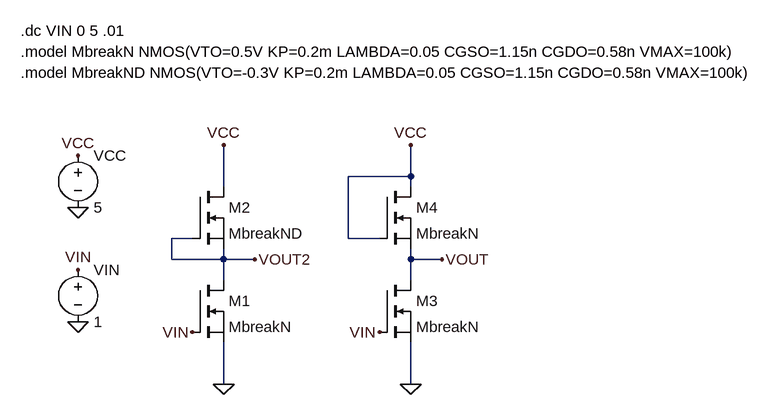
[diagram p0: schematic I_2.asc]
I_2.asc, the LTspice schematic file:
Version 4.1
SHEET 1 1412 680
WIRE 608 96 608 48
WIRE 608 96 512 96
WIRE 320 112 320 48
WIRE 608 112 608 96
WIRE 272 192 240 192
WIRE 512 192 512 96
WIRE 560 192 512 192
WIRE 240 224 240 192
WIRE 320 224 320 208
WIRE 320 224 240 224
WIRE 368 224 320 224
WIRE 608 224 608 208
WIRE 656 224 608 224
WIRE 320 256 320 224
WIRE 608 256 608 224
WIRE 320 416 320 352
WIRE 608 416 608 352
FLAG 320 416 0
FLAG 96 144 0
FLAG 96 64 VCC
FLAG 320 48 VCC
FLAG 96 320 0
FLAG 96 240 VIN
FLAG 272 336 VIN
FLAG 368 224 VOUT2
FLAG 608 416 0
FLAG 608 48 VCC
FLAG 560 336 VIN
FLAG 656 224 VOUT
SYMBOL nmos 272 256 R0
SYMATTR InstName M1
SYMATTR Value MbreakN
SYMBOL voltage 96 48 R0
WINDOW 123 0 0 Left 0
WINDOW 39 0 0 Left 0
SYMATTR InstName VCC
SYMATTR Value 5
SYMBOL nmos 272 112 R0
SYMATTR InstName M2
SYMATTR Value MbreakND
SYMBOL voltage 96 224 R0
WINDOW 123 0 0 Left 0
WINDOW 39 0 0 Left 0
SYMATTR InstName VIN
SYMATTR Value 1
SYMBOL nmos 560 256 R0
SYMATTR InstName M3
SYMATTR Value MbreakN
SYMBOL nmos 560 112 R0
SYMATTR InstName M4
SYMATTR Value MbreakN
TEXT 8 -96 Left 2 !.model MbreakN NMOS(VTO=0.5V KP=0.2m LAMBDA=0.05 CGSO=1.15n CGDO=0.58n VMAX=100k)
TEXT 8 -64 Left 2 !.model MbreakND NMOS(VTO=-0.3V KP=0.2m LAMBDA=0.05 CGSO=1.15n CGDO=0.58n VMAX=100k)
TEXT 8 -128 Left 2 !.dc VIN 0 5 .01

The netlist it stands for:
* I_2.asc
M1 VOUT2 VIN 0 0 MbreakN
VCC VCC 0 5
M2 VCC VOUT2 VOUT2 VOUT2 MbreakND
VIN VIN 0 1
M3 VOUT VIN 0 0 MbreakN
M4 VCC VCC VOUT VOUT MbreakN
.model NMOS NMOS
.model PMOS PMOS
.lib standard.mos
.model MbreakN NMOS(VTO=0.5V KP=0.2m LAMBDA=0.05 CGSO=1.15n CGDO=0.58n VMAX=100k)
.model MbreakND NMOS(VTO=-0.3V KP=0.2m LAMBDA=0.05 CGSO=1.15n CGDO=0.58n VMAX=100k)
.dc VIN 0 5 .01
.backanno
.end